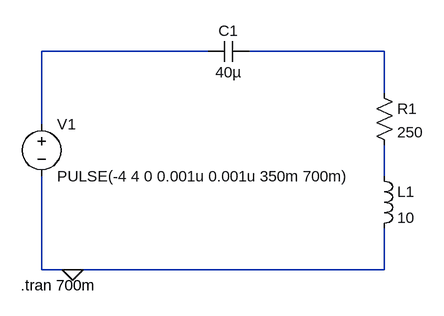
[diagram p0: schematic Draft3.Copy3asc.asc]
Draft3.Copy3asc.asc, the LTspice schematic file:
Version 4.1
SHEET 1 880 680
WIRE 48 16 -208 16
WIRE 320 16 112 16
WIRE 320 80 320 16
WIRE -208 128 -208 16
WIRE 320 208 320 160
WIRE -208 352 -208 208
WIRE -160 352 -208 352
WIRE 320 352 320 288
WIRE 320 352 -160 352
FLAG -160 352 0
SYMBOL res 304 64 R0
SYMATTR InstName R1
SYMATTR Value 250
SYMBOL voltage -208 112 R0
WINDOW 123 0 0 Left 0
WINDOW 39 0 0 Left 0
SYMATTR InstName V1
SYMATTR Value PULSE(-4 4 0 0.001u 0.001u 350m 700m)
SYMBOL ind 304 192 R0
SYMATTR InstName L1
SYMATTR Value 10
SYMATTR SpiceLine Rser=1m
SYMBOL cap 48 32 R270
WINDOW 0 32 32 VTop 2
WINDOW 3 0 32 VBottom 2
SYMATTR InstName C1
SYMATTR Value 40µ
TEXT -240 376 Left 2 !.tran 700m

The netlist it stands for:
* Draft3.Copy3asc.asc
R1 N002 N003 250
V1 N001 0 PULSE(-4 4 0 0.001u 0.001u 350m 700m)
L1 N003 0 10 Rser=1m
C1 N001 N002 40µ
.tran 700m
.backanno
.end